# Altium schematic sheet CONN_OUTPUT.SchDoc
size 558 x 431 mm; SheetNumber: 6; SheetTotal: 6
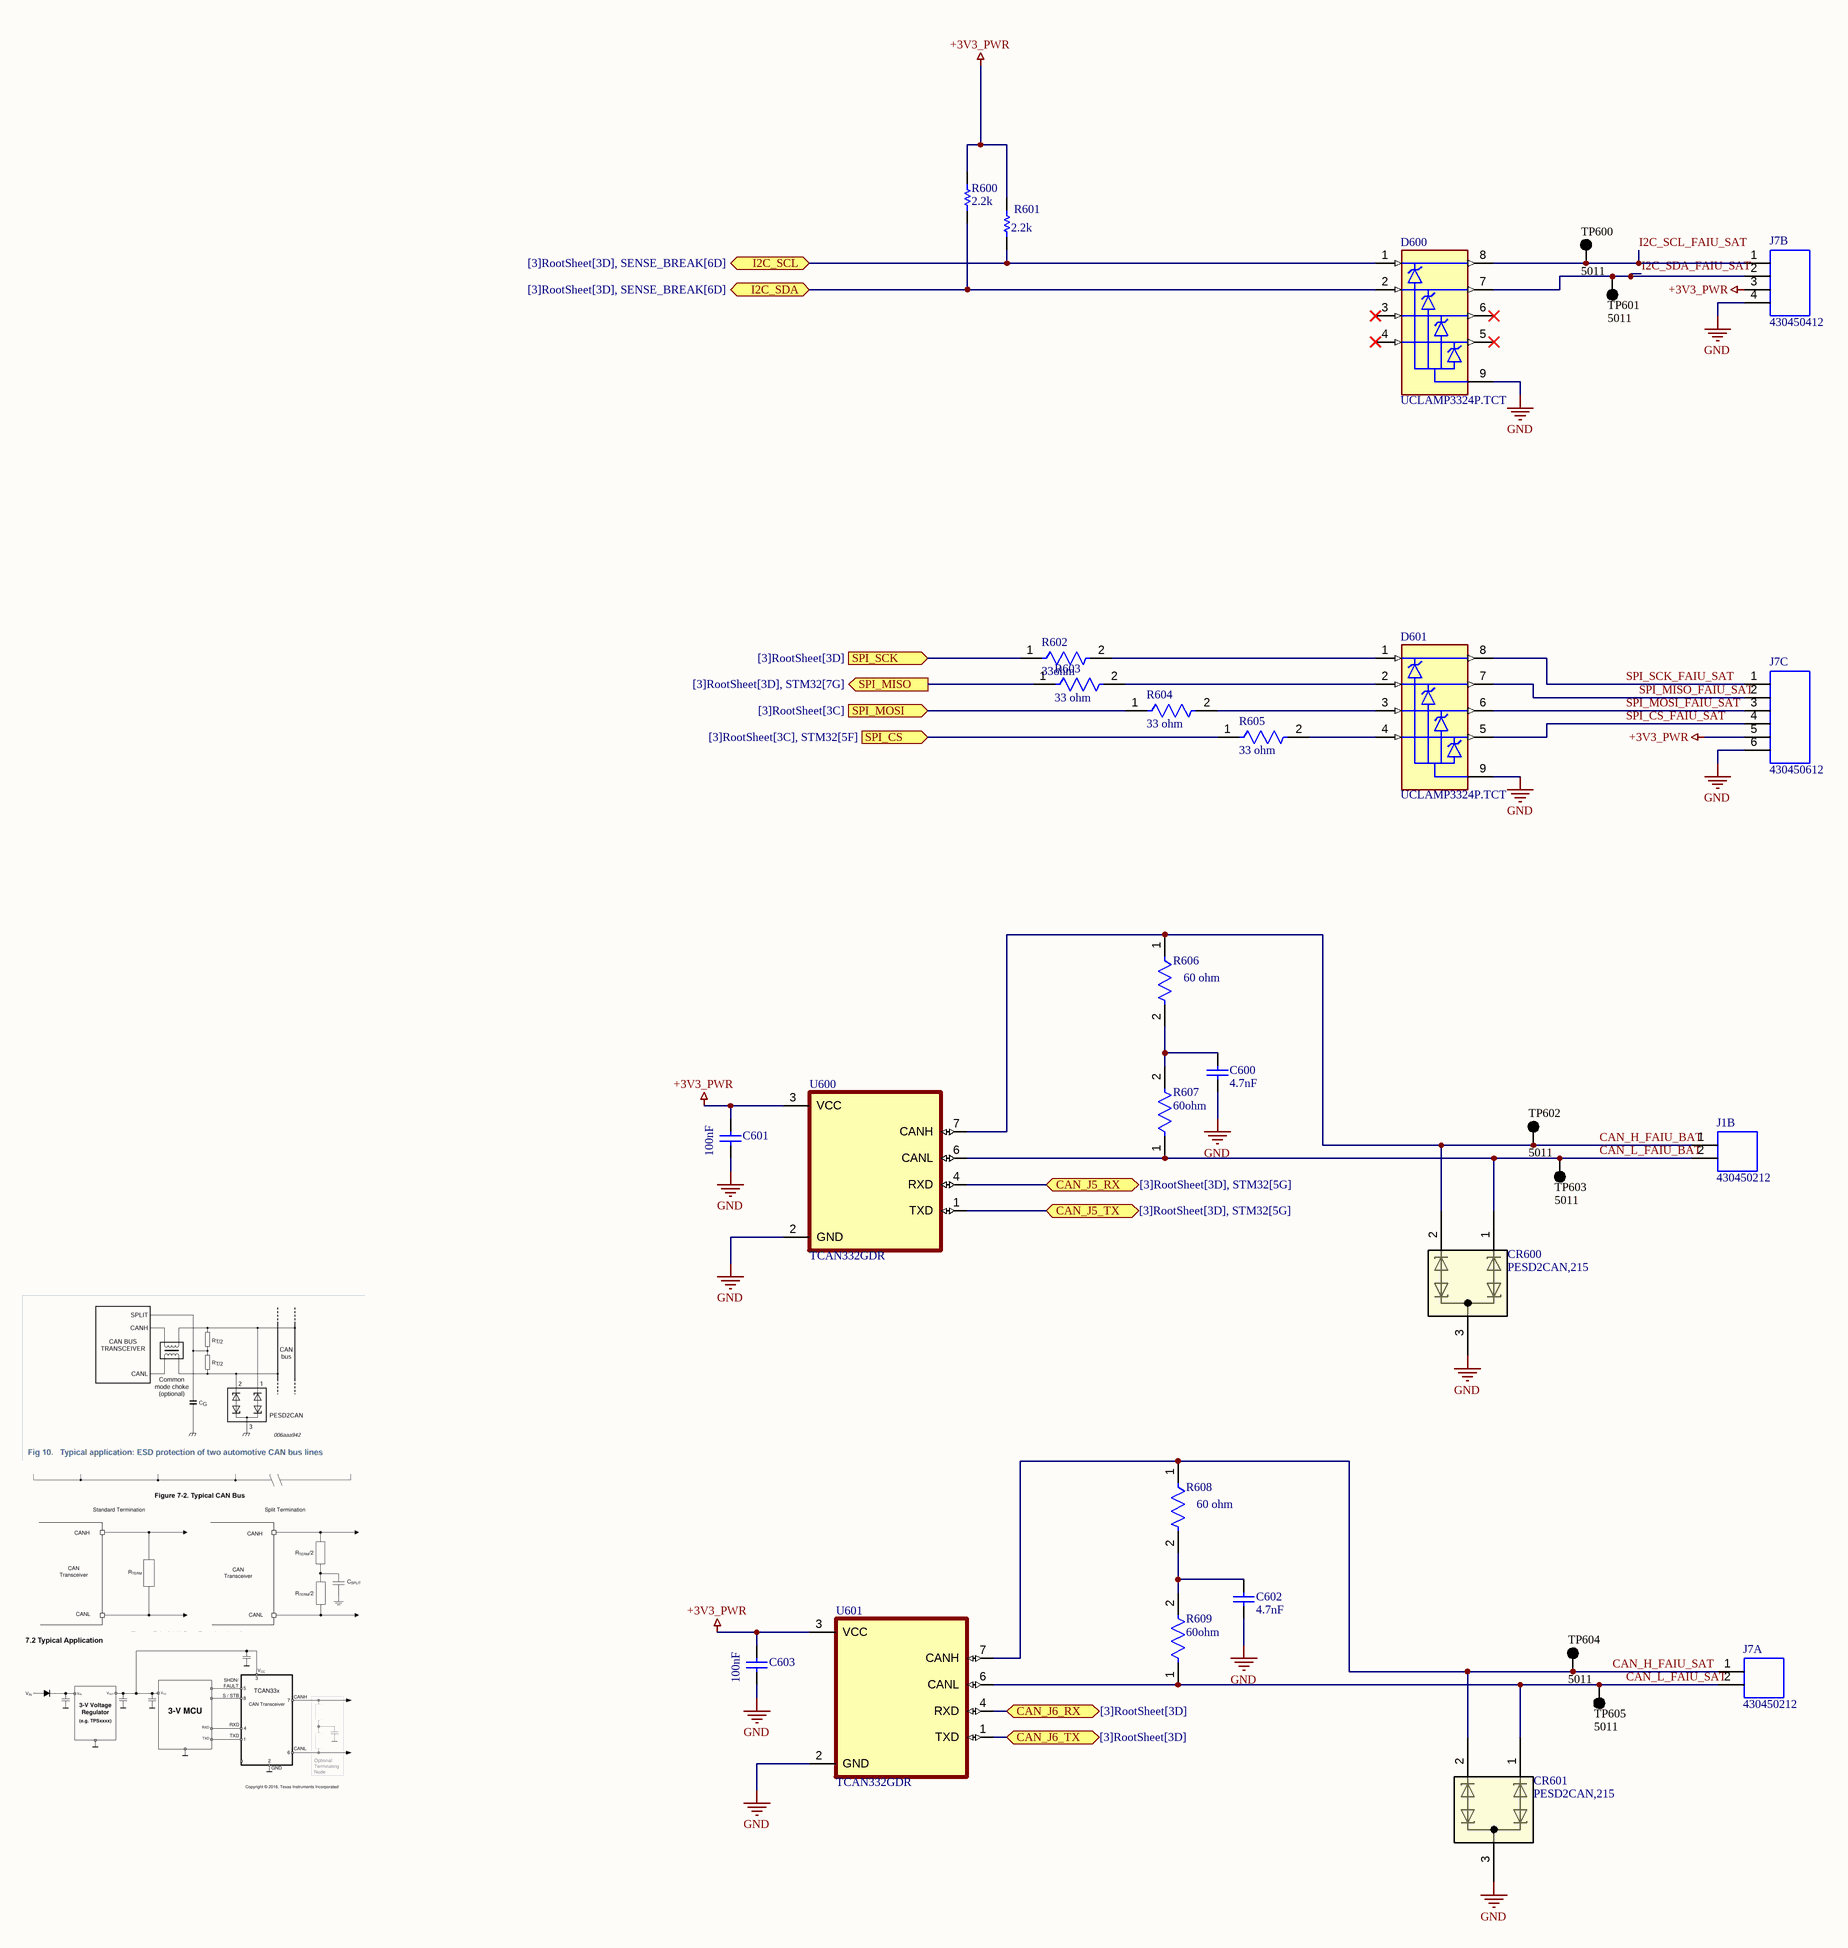
[diagram p0: CONN_OUTPUT.SchDoc]

## Parts
C600  4.7nF  [CAPC1608X90X35LL10T15]
C601  100nF  [CAPC1608X90X35LL10T15]
C602  4.7nF  [CAPC1608X90X35LL10T15]
C603  100nF  [CAPC1608X90X35LL10T15]
CR600  PESD2CAN,215  [SOT23_TO-236AB_NEX]
CR601  PESD2CAN,215  [SOT23_TO-236AB_NEX]
D600  UCLAMP3324P.TCT  [SON50P210X160X65-9N]
D601  UCLAMP3324P.TCT  [SON50P210X160X65-9N]
J1B  430450212  [CONN_SD-43045-005_02_MOL]
J7A  430450212  [CONN_SD-43045-005_02_MOL]
J7B  430450412  [CONN_SD-43045-005_04_MOL]
J7C  430450612  [CONN_SD-43045-005_06_MOL]
R600  2.2k  [RESC1609X50X30NL10T20]
R601  2.2k  [RESC1609X50X30NL10T20]
R602  33ohm  [FP-CRCW0603-e3-IPC_A]
R603  33 ohm  [FP-CRCW0603-e3-IPC_A]
R604  33 ohm  [FP-CRCW0603-e3-IPC_A]
R605  33 ohm  [FP-CRCW0603-e3-IPC_A]
R606  60 ohm  [FP-CRCW0603-e3-IPC_C]
R607  60ohm  [FP-CRCW0603-e3-IPC_C]
R608  60 ohm  [FP-CRCW0603-e3-IPC_C]
R609  60ohm  [FP-CRCW0603-e3-IPC_C]
TP600  5011  [KSTN-5011_V]
TP601  5011  [KSTN-5011_V]
TP602  5011  [KSTN-5011_V]
TP603  5011  [KSTN-5011_V]
TP604  5011  [KSTN-5011_V]
TP605  5011  [KSTN-5011_V]
U600  TCAN332GDR  [SOIC127P599X175-8N]
U601  TCAN332GDR  [SOIC127P599X175-8N]

## Ports
CAN_J5_RX (bidir, see [3]RootSheet[3D], STM32[5G]), CAN_J5_TX (bidir, see [3]RootSheet[3D], STM32[5G]), CAN_J6_RX (bidir, see [3]RootSheet[3D]), CAN_J6_TX (bidir, see [3]RootSheet[3D]), I2C_SCL (bidir, see [3]RootSheet[3D], SENSE_BREAK[6D]), I2C_SDA (bidir, see [3]RootSheet[3D], SENSE_BREAK[6D]), SPI_CS (in, see [3]RootSheet[3C], STM32[5F]), SPI_MISO (out, see [3]RootSheet[3D], STM32[7G]), SPI_MOSI (in, see [3]RootSheet[3C]), SPI_SCK (in, see [3]RootSheet[3D])

## Nets
+3V3_PWR: C601.2 C603.2 J7B.3 J7C.5 R600.2 R601.2 U600.3(VCC) U601.3(VCC)
GND: C600.2 C601.1 C602.2 C603.1 CR600.3(COMMONCATHODE) CR601.3(COMMONCATHODE) D600.9(GND) D601.9(GND) J7B.4 J7C.6 U600.2(GND) U601.2(GND)
CAN_H_FAIU_BAT: CR600.2(CATHODE) J1B.1 R606.1 TP602.1 U600.7(CANH)
CAN_H_FAIU_SAT: CR601.2(CATHODE) J7A.1 R608.1 TP604.1 U601.7(CANH)
CAN_J5_RX: U600.4(RXD) ; port CAN_J5_RX
CAN_J5_TX: U600.1(TXD) ; port CAN_J5_TX
CAN_J6_RX: U601.4(RXD) ; port CAN_J6_RX
CAN_J6_TX: U601.1(TXD) ; port CAN_J6_TX
CAN_L_FAIU_BAT: CR600.1(CATHODE) J1B.2 R607.1 TP603.1 U600.6(CANL)
CAN_L_FAIU_SAT: CR601.1(CATHODE) J7A.2 R609.1 TP605.1 U601.6(CANL)
I2C_SCL: D600.1 R601.1 ; port I2C_SCL
I2C_SCL_FAIU_SAT: D600.8 J7B.1 TP600.1
I2C_SDA: D600.2 R600.1 ; port I2C_SDA
I2C_SDA_FAIU_SAT: D600.7 J7B.2 TP601.1
SPI_CS: R605.1 ; port SPI_CS
SPI_CS_FAIU_SAT: D601.5 J7C.4
SPI_MISO: R603.1 ; port SPI_MISO
SPI_MISO_FAIU_SAT: D601.7 J7C.2
SPI_MOSI: R604.1 ; port SPI_MOSI
SPI_MOSI_FAIU_SAT: D601.6 J7C.3
SPI_SCK: R602.1 ; port SPI_SCK
SPI_SCK_FAIU_SAT: D601.8 J7C.1
NetC600_1: C600.1 R606.2 R607.2
NetC602_1: C602.1 R608.2 R609.2
NetD601_1: D601.1 R602.2
NetD601_2: D601.2 R603.2
NetD601_3: D601.3 R604.2
NetD601_4: D601.4 R605.2

Not connected (* = marked no-connect by the designer): D600 3* 4* 5* 6*

## Notes on the sheet
- DWG. NO.
- REV.
- SHT.
- REVISION
- DESCRIPTION
- DATE
- APPROVED
- THIS DOCUMENT AND THE DATA DISCLOSED HEREIN OR HEREWITH IS THE PROPERTY OF ALTIUM LIMITED AND MAY BE FREELY DISTRIBUTED IN WHOLE. NO RIGHTS ARE RESERVED OR EXPRESS OR IMPLIED WARANTEE GIVEN.
- ENG:
- DSN:
- APPROVALS
- PROJECT
- DOCUMENT REVISION:
- DESIGN ITEM:
- CHK:
- BOM:
- REFERENCE DOCUMENTS
- PROJECT REVISION:
- TITLE
- FAB DWG:
- PCB DWG:
- ASSY DWG:
- SCALE:
- SIZE
- C
- CAGE CODE
- FILE NAME
- DWG NO.
- SHEET
- OF
- REV

## Library data of the parts
C600-C603 = CMP-2006-02386-1: Manufacturer: Murata; Part Number: GCM188R71H472KA37D
CR600 CR601 = PESD2CAN,215: Description; Manufacturer_Name: Nexperia; Copyright: Copyright (C) 2026 Ultra Librarian. All rights reserved.; Manufacturer_Part_Number: PESD2CAN,215; RefDes: RefDes; Type: Type
D600 D601 = UCLAMP3324P.TCT: 8V Clamp 5A (8/20Âµs) Ipp Tvs Diode Surface Mount SLP2116P8 (2.1x1.6); MF: Semtech Corporation; SnapEDA_Link: https://www.snapeda.com/parts/UCLAMP3324P.TCT/Semtech/view-part/?ref=snap; Package: UFDFN-8 Semtech Corporation; Value: *; MP: UCLAMP3324P.TCT; Check_prices: https://www.snapeda.com/parts/UCLAMP3324P.TCT/Semtech/view-part/?ref=eda
J1B J7A = 430450212: Connector Header Through Hole 2 position; MF: Molex; SnapEDA_Link: https://www.snapeda.com/parts/430450212/Molex/view-part/?ref=snap; Package: None; Value: *; MP: 430450212; Check_prices: https://www.snapeda.com/parts/430450212/Molex/view-part/?ref=eda
J7B = 430450412: Conn Wire to Board HDR 4Power POS 3mm Solder ST Top Entry Thru-Hole Micro-Fit 3.0â„¢ Tray; MF: Molex; SnapEDA_Link: https://www.snapeda.com/parts/430450412/Molex/view-part/?ref=snap; Package: None; Value: *; MP: 430450412; Check_prices: https://www.snapeda.com/parts/430450412/Molex/view-part/?ref=eda
J7C = 430450612: Conn Wire to Board HDR 6 POS 3mm Solder ST Top Entry Thru-Hole Micro-Fit 3.0â„¢ Tray; MF: Molex; SnapEDA_Link: https://www.snapeda.com/parts/430450612/Molex/view-part/?ref=snap; Package: None; Value: *; MP: 430450612; Check_prices: https://www.snapeda.com/parts/430450612/Molex/view-part/?ref=eda
R600 R601 = CMP-2000-03167-1: Part Number: CRCW06032K20FKEA; Manufacturer: Vishay Dale
R602-R605 = CMP-2000-03250-2: RES Thick Film, 33Ω, 1%, 0.1W, 100ppm/°C, 0603; Voltage Rating: 75V; Max Power Dissipation: 100mW; Resistance: 33R; Case/Package: 0603; Weight: 7.1E-05oz; Termination: SMD/SMT; Voltage Rating (DC): 75V; Packaging: Tape and Reel; Width: 0.85mm; Depth: 0.85mm; Mount: Surface Mount; Number of Terminations: 2; Min Operating Temperature: -55°C; Military Standard: Not; Package Quantity: 10; Contact Plating: Tin; Radiation Hardening: No; Lead Free: Lead Free; Tolerance: 1%; Power Rating: 100mW; Features: Automotive AEC-Q200; Height: 0.45mm; Case Code (Metric): 1608; Length: 1.55mm; Composition: Thick Film; Max Operating Temperature: 155°C; Temperature Coefficient: 100ppm/°C; Case Code (Imperial): 0603
R606-R609 = CMP-2000-03506-2: RES Thick Film, 60.4Ω, 1%, 0.1W, 100ppm/°C, 0603; Working Voltage: 75V; Power Rating: 100mW; Resistance: 60.4R; Package Quantity: 10; Termination: SMD/SMT; Features: Automotive AEC-Q200; Mount: Surface Mount; Min Operating Temperature: -55°C; Temperature Coefficient: 100ppm/°C; Height: 0.45mm; Max Operating Temperature: 155°C; Depth: 0.85mm; Packaging: Tape and Reel; Voltage Rating: 75V; Tolerance: 1%; Case Code (Imperial): 0603; Composition: Thick Film; Number of Terminations: 2; Weight: 7.1E-05oz; Contact Plating: Tin; Width: 0.033inch; Radiation Hardening: No; Case/Package: 0603; Case Code (Metric): 1608; Lead Free: Lead Free; Max Power Dissipation: 100mW; Length: 1.55mm; Voltage Rating (DC): 75V; Military Standard: Not
TP600-TP605 = CMP-1672-00003-4: Test Point, Black, Through Hole, RoHS, Bulk; Manufacturer: Keystone; ComponentLink2URL: http://www.keyelco.com/product-pdf.cfm?p=1320; Colour: Black; Pins: 1; REACH SVHC: No SVHC; ComponentLink1URL: http://www.keyelco.com/; PackageReference: 5011; Contact Plating: Silver; Package Quantity: 100; Packaging: Bulk; RoHSCompliant: true; Height: 8.12 mm; PackageDescription: 1-Pin Through Hole Device, Dia 3.17 mm; Mount: Through Hole; Mounting Technology: Through Hole; DatasheetVersion: Rev. F, 12/2013; ComponentLink1Description: Manufacturer URL; Contact Material: Bronze; ComponentLink2Description: Datasheet
U600 U601 = TCAN332GDR: 3.3-V CAN Transceivers with CAN FD (Flexible Data Rate); MF: Texas Instruments; SnapEDA_Link: https://www.snapeda.com/parts/TCAN332GDR/Texas+Instruments/view-part/?ref=snap; Package: SOIC-8 Texas Instruments; Value: *; MP: TCAN332GDR; Check_prices: https://www.snapeda.com/parts/TCAN332GDR/Texas+Instruments/view-part/?ref=eda